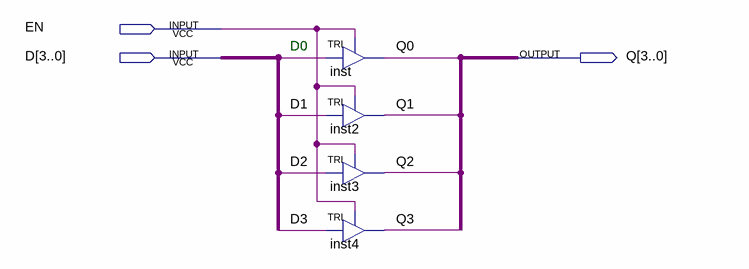
[diagram p0: schematic sheet]
// Quartus schematic tri_4.bdf as structural Verilog: 4 symbols, 3 pins
module tri_4 (
  input  EN,
  input  [3:0] D,
  output [3:0] Q
);

  TRI inst (.IN(D[0]), .OE(EN), .OUT(Q[0]));
  TRI inst2 (.IN(D[1]), .OE(EN), .OUT(Q[1]));
  TRI inst3 (.IN(D[2]), .OE(EN), .OUT(Q[2]));
  TRI inst4 (.IN(D[3]), .OE(EN), .OUT(Q[3]));

  // Notes on the sheet:
  //   D0
endmodule
